# Altium project Industrial_IOT_Dev_Brd-v1.0.PrjPcb (part 5 of 7)

## Sheet Digital-Input-Sheet.SchDoc
size 420 x 297 mm; SheetNumber: 6; SheetTotal: 9
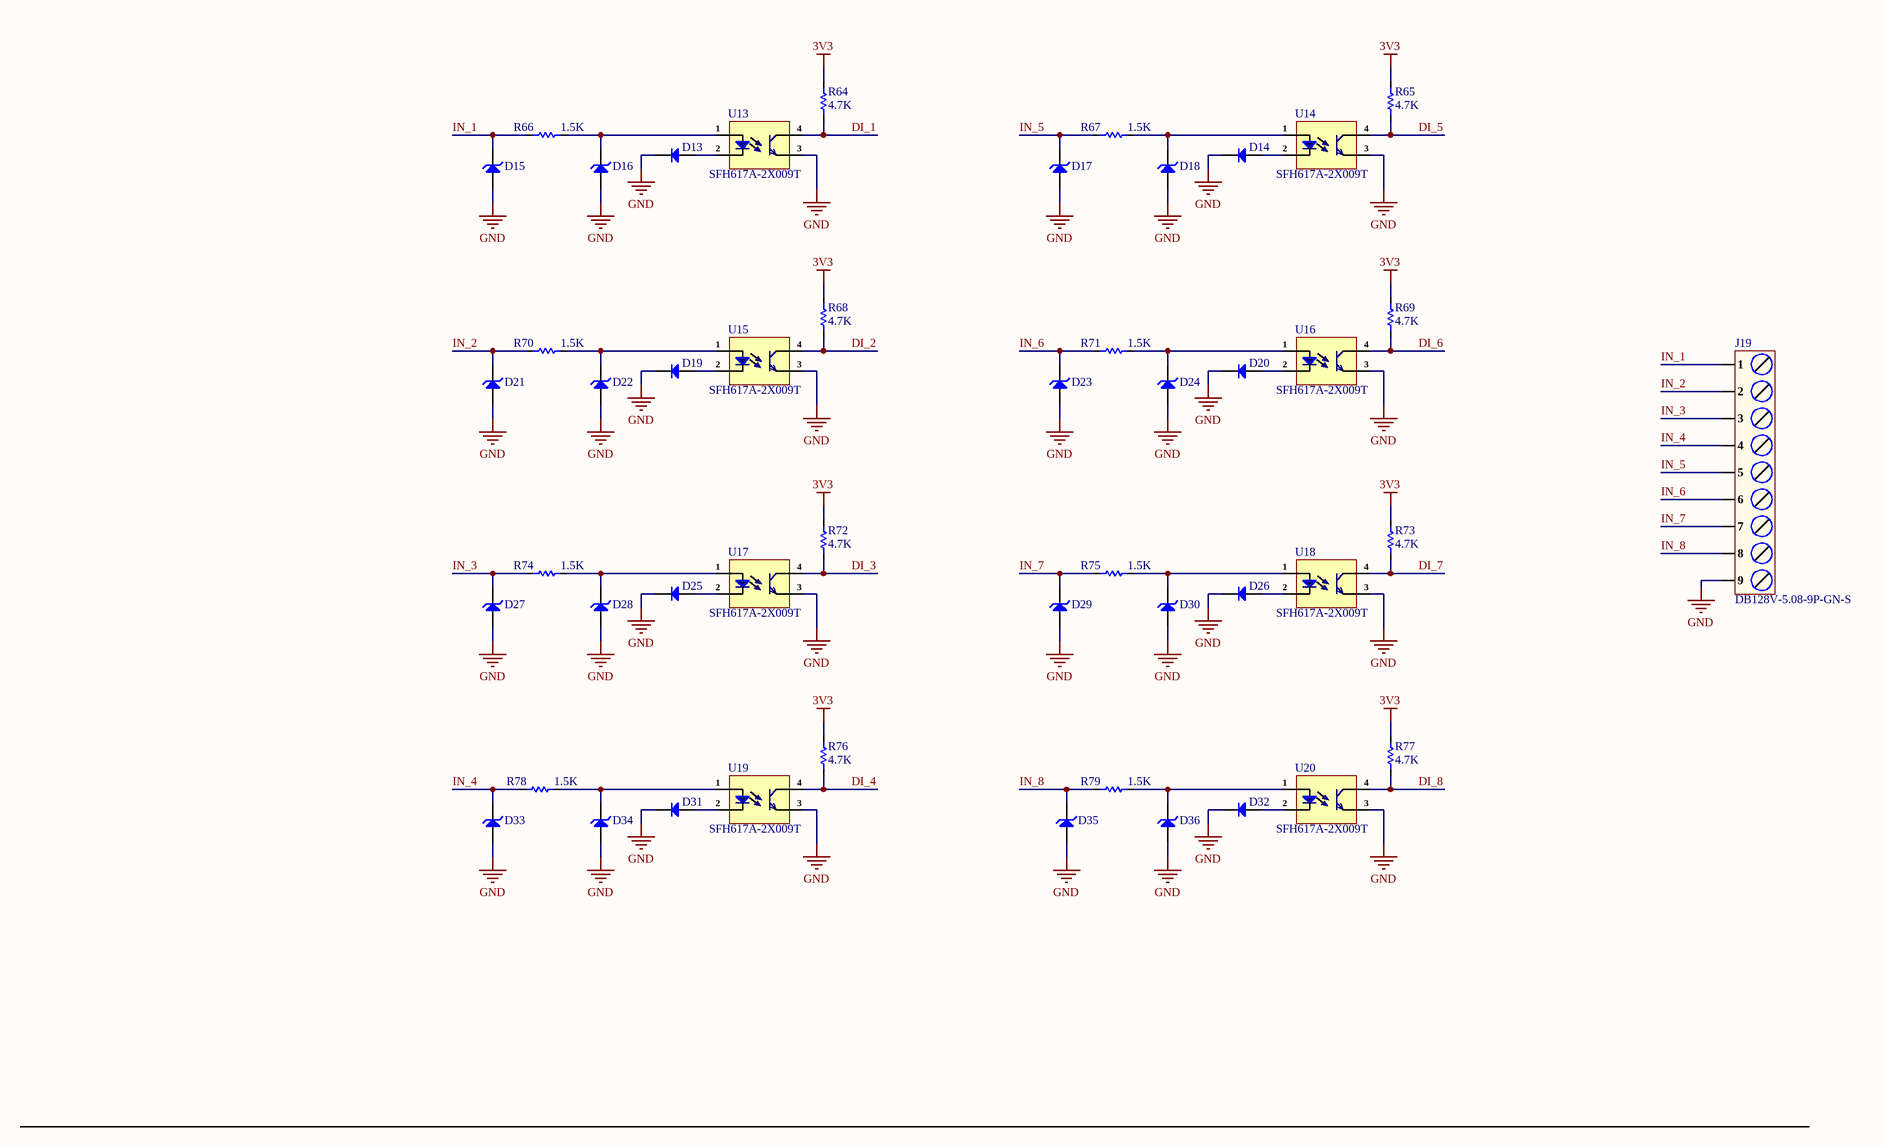
[diagram p5: Digital-Input-Sheet.SchDoc]

### Parts
D13  1N4148W-7-F  [SOD-123]  (value not drawn)
D14  1N4148W-7-F  [SOD-123]  (value not drawn)
D15  AZ4024-01G  [SOD-123]  (value not drawn)
D16  BZT52C24  [SOD-123]  (value not drawn)
D17  AZ4024-01G  [SOD-123]  (value not drawn)
D18  BZT52C24  [SOD-123]  (value not drawn)
D19  1N4148W-7-F  [SOD-123]  (value not drawn)
D20  1N4148W-7-F  [SOD-123]  (value not drawn)
D21  AZ4024-01G  [SOD-123]  (value not drawn)
D22  BZT52C24  [SOD-123]  (value not drawn)
D23  AZ4024-01G  [SOD-123]  (value not drawn)
D24  BZT52C24  [SOD-123]  (value not drawn)
D25  1N4148W-7-F  [SOD-123]  (value not drawn)
D26  1N4148W-7-F  [SOD-123]  (value not drawn)
D27  AZ4024-01G  [SOD-123]  (value not drawn)
D28  BZT52C24  [SOD-123]  (value not drawn)
D29  AZ4024-01G  [SOD-123]  (value not drawn)
D30  BZT52C24  [SOD-123]  (value not drawn)
D31  1N4148W-7-F  [SOD-123]  (value not drawn)
D32  1N4148W-7-F  [SOD-123]  (value not drawn)
D33  AZ4024-01G  [SOD-123]  (value not drawn)
D34  BZT52C24  [SOD-123]  (value not drawn)
D35  AZ4024-01G  [SOD-123]  (value not drawn)
D36  BZT52C24  [SOD-123]  (value not drawn)
J19  DB128V-5.08-9P-GN-S  [DB128V-5.08-9P-GN-S]
R64  4.7K  [Res-0402]
R65  4.7K  [Res-0402]
R66  1.5K  [Res-0603]
R67  1.5K  [Res-0603]
R68  4.7K  [Res-0402]
R69  4.7K  [Res-0402]
R70  1.5K  [Res-0603]
R71  1.5K  [Res-0603]
R72  4.7K  [Res-0402]
R73  4.7K  [Res-0402]
R74  1.5K  [Res-0603]
R75  1.5K  [Res-0603]
R76  4.7K  [Res-0402]
R77  4.7K  [Res-0402]
R78  1.5K  [Res-0603]
R79  1.5K  [Res-0603]
U13  SFH617A-2X009T  [SFH617A-2X009T]
U14  SFH617A-2X009T  [SFH617A-2X009T]
U15  SFH617A-2X009T  [SFH617A-2X009T]
U16  SFH617A-2X009T  [SFH617A-2X009T]
U17  SFH617A-2X009T  [SFH617A-2X009T]
U18  SFH617A-2X009T  [SFH617A-2X009T]
U19  SFH617A-2X009T  [SFH617A-2X009T]
U20  SFH617A-2X009T  [SFH617A-2X009T]

### Nets
3V3: R64.2 R65.2 R68.2 R69.2 R72.2 R73.2 R76.2 R77.2
GND: D13.2(K) D14.2(K) D15.1(A) D16.1(A) D17.1(A) D18.1(A) D19.2(K) D20.2(K) D21.1(A) D22.1(A) D23.1(A) D24.1(A) D25.2(K) D26.2(K) D27.1(A) D28.1(A) D29.1(A) D30.1(A) D31.2(K) D32.2(K) D33.1(A) D34.1(A) D35.1(A) D36.1(A) J19.9 U13.3(E) U14.3(E) U15.3(E) U16.3(E) U17.3(E) U18.3(E) U19.3(E) U20.3(E)
DI_1: R64.1 U13.4(C)
DI_2: R68.1 U15.4(C)
DI_3: R72.1 U17.4(C)
DI_4: R76.1 U19.4(C)
DI_5: R65.1 U14.4(C)
DI_6: R69.1 U16.4(C)
DI_7: R73.1 U18.4(C)
DI_8: R77.1 U20.4(C)
IN_1: D15.2(K) J19.1 R66.1
IN_2: D21.2(K) J19.2 R70.1
IN_3: D27.2(K) J19.3 R74.1
IN_4: D33.2(K) J19.4 R78.1
IN_5: D17.2(K) J19.5 R67.1
IN_6: D23.2(K) J19.6 R71.1
IN_7: D29.2(K) J19.7 R75.1
IN_8: D35.2(K) J19.8 R79.1
NetD13_1: D13.1(A) U13.2(Ca)
NetD14_1: D14.1(A) U14.2(Ca)
NetD16_2: D16.2(K) R66.2 U13.1(An)
NetD18_2: D18.2(K) R67.2 U14.1(An)
NetD19_1: D19.1(A) U15.2(Ca)
NetD20_1: D20.1(A) U16.2(Ca)
NetD22_2: D22.2(K) R70.2 U15.1(An)
NetD24_2: D24.2(K) R71.2 U16.1(An)
NetD25_1: D25.1(A) U17.2(Ca)
NetD26_1: D26.1(A) U18.2(Ca)
NetD28_2: D28.2(K) R74.2 U17.1(An)
NetD30_2: D30.2(K) R75.2 U18.1(An)
NetD31_1: D31.1(A) U19.2(Ca)
NetD32_1: D32.1(A) U20.2(Ca)
NetD34_2: D34.2(K) R78.2 U19.1(An)
NetD36_2: D36.2(K) R79.2 U20.1(An)

### Notes on the sheet
- File:
- Title:
- Date:
- Page
- Num:
- Total:
- Drawn By: Huzaifa Ali

### Library data of the parts
D13 D14 D19 D20 D25 D26 D31 D32 = 1N4148W-7-F: DIODE GEN PURP 100V 300MA SOD123; Manufacturer: Diodes; Forward Current: 150mA; Reverse Recovery Time: 4ns; Max Forward Surge Current (Ifsm): 2A; Element Configuration: Single; Max Reverse Current: 1uA; Forward Voltage: 1.25V; Power Dissipation: 400mW; Polarity: Standard; Voltage Rating (DC): 75V; Value: 2pF; Supplier 1: Future Electronics; Manufacturer Part Number: 1N4148W-7-F; RoHS: Yes; Category: Rectifier Diodes; Stock 1: 32931000; Pricing 1: 3000=0.01840, 12000=0.01760, 45000=0.01690, 120000=0.01640, 300000=0.01560 (USD); Mounting Technology: Surface Mount; Pins: 2; Weight: 0.000353oz; Contact Plating: Tin,Matte; Min Operating Temperature: -65°C; Max Operating Temperature: 150°C; Packaging: Tape and Reel; Max Repetitive Reverse Voltage (Vrrm): 100V; Peak Non-Repetitive Surge Current: 2A; Voltage: 100V; Max Surge Current: 2A; Package Quantity: 3000; Recovery Time: 4ns; Average Rectified Current: 300mA; Power Rating: 400mW; Current Rating: 150mA; Output Current: 150mA; Max Reverse Voltage (DC): 100V; Series: -; Reverse Recovery Time-Max: 4ns; Length: 2.85mm; Width: 1.7mm; Height: 1.25mm; Radiation Hardening: No; RoHS Compliant: Yes; Reach SVHC Compliant: Yes; Lead Free: Lead Free; ComponentLink1URL: https://datasheet.ciiva.com/1179/1915529-1179304.pdf?src-supplier=Element14; ComponentLink1Description: https://datasheet.ciiva.com/1179/1915529-1179304.pdf?src-supplier=Element14; ComponentLink2URL: https://datasheet.ciiva.com/22695/1915529-22695239.pdf?src-supplier=Element14; ComponentLink2Description: https://datasheet.ciiva.com/22695/1915529-22695239.pdf?src-supplier=Element14; ComponentLink3URL: https://datasheet.ciiva.com/8300/ds30086-8300392.pdf?src-supplier=Avnet; ComponentLink3Description: https://datasheet.ciiva.com/8300/ds30086-8300392.pdf?src-supplier=Avnet; ComponentLink4URL: https://datasheet.ciiva.com/15219/getdatasheetpartid-110030-15219548.pdf?src-supplier=Verical; ComponentLink4Description: https://datasheet.ciiva.com/15219/getdatasheetpartid-110030-15219548.pdf?src-supplier=Verical; ComponentLink5URL: https://datasheet.ciiva.com/8303/ds30086-8303197.pdf?src-supplier=Avnet; ComponentLink5Description: https://datasheet.ciiva.com/8303/ds30086-8303197.pdf?src-supplier=Avnet; ComponentLink6URL: https://datasheet.ciiva.com/911/ds30086-911735.pdf?src-supplier=Digi-Key; ComponentLink6Description: https://datasheet.ciiva.com/911/ds30086-911735.pdf?src-supplier=Digi-Key; ComponentLink7URL: https://datasheet.ciiva.com/911/ds30086-911736.pdf?src-supplier=Digi-Key; ComponentLink7Description: https://datasheet.ciiva.com/911/ds30086-911736.pdf?src-supplier=Digi-Key; ComponentLink8URL: https://datasheet.ciiva.com/911/ds30086-911734.pdf?src-supplier=Digi-Key; ComponentLink8Description: https://datasheet.ciiva.com/911/ds30086-911734.pdf?src-supplier=Digi-Key; ComponentLink9URL: https://datasheet.ciiva.com/4435/ds30086-4435128.pdf?src-supplier=Mouser; ComponentLink9Description: https://datasheet.ciiva.com/4435/ds30086-4435128.pdf?src-supplier=Mouser; Supplier Part Number 1: 7634694; LCSC Part Number: C83528; Item Type: Diode
D15 D17 D21 D23 D27 D29 D33 D35 = AZ4024-01G: 26.7V 24V SOD-123 ESD and Surge Protection (TVS/ESD) ROHS; Manufacturer: AMAZING; Manufacturer Part Number: AZ4024-01G; Package: SOD-123; LCSC Part Number: C5571859; Item Type: (TVS/ESD); ComponentLink1Description: LCSC; ComponentLink1URL: https://www.lcsc.com/product-detail/ESD-and-Surge-Protection-TVS-ESD_AMAZING-AZ4024-01G_C5571859.html
D16 D18 D22 D24 D28 D30 D34 D36 = BZT52C24: Independent Type 22.8V~25.6V 500mW 24V SOD-123 Zener Diodes ROHS; Manufacturer: BORN; Manufacturer Part Number: BZT52C24; Package: SOD-123; LCSC Part Number: C266572; Item Type: Zener Diode
J19 = DB128V-5.08-9P-GN-S: 1x9P 20A -40℃~+105℃ 300V Green 12~30 Straight pin 5.08mm 2.5 1 9 Plugin,P=5.08mm Screw terminal ROHS; Manufacturer: DIBO; Item Type: Terminal Block; Manufacturer Part Number: DB128V-5.08-9P-GN-S; Package: Plugin,P=5.08mm; LCSC Part Number: C2938972; ComponentLink1Description: LCSC; ComponentLink1URL: https://www.lcsc.com/product-detail/Screw-terminal_DIBO-DB128V-5-08-9P-GN-S_C2938972.html
R64 R65 R68 R69 R72 R73 R76 R77 = RC0402FR-074K7L: RES 4.7K OHM 1% 1/16W 0402; Manufacturer: Yageo; Voltage Rating (DC): 50V; Power Rating: 62.5mW; Resistance: 4.7kR; Temperature Coefficient: 100ppm/°C; Max Power Dissipation: 63mW; Item Type: Resistor; Supplier 1: Avnet; Manufacturer Part Number: RC0402FR-074K7L; RoHS: Yes; Category: Chip SMD Resistors; Stock 1: 2420000; Pricing 1: 10000=0.00085 (USD); Case/Package: 0402; Number of Pins: 2; Case Code (Imperial): 0402; Case Code (Metric): 1005; Size Code: 0402; Min Operating Temperature: -55°C; Max Operating Temperature: 155°C; Tolerance: 1%; Voltage Rating: 50V; Packaging: Tape and Reel; Resistor Type: Thick Film; Termination: SMD/SMT; Features: Moisture Resistant; Series: RC; Number of Terminations: 2; Resistance Tolerance: 1%; Construction: Rectangular; Length: 1mm; Width: 0.5mm; Height: 0.32mm; Depth: 0.5mm; Height - Seated (Max): 0.016inch; RoHS Compliant: Yes; Reach SVHC Compliant: Yes; Military Standard: Not; Lead Free: Lead Free; ComponentLink1URL: https://datasheet.ciiva.com/22661/1686128-22661342.pdf?src-supplier=Element14; ComponentLink1Description: https://datasheet.ciiva.com/22661/1686128-22661342.pdf?src-supplier=Element14; ComponentLink2URL: https://datasheet.ciiva.com/7850/1018594-7850022.pdf?src-supplier=Element14; ComponentLink2Description: https://datasheet.ciiva.com/7850/1018594-7850022.pdf?src-supplier=Element14; ComponentLink3URL: https://datasheet.ciiva.com/7850/1018594-7850023.pdf?src-supplier=Element14; ComponentLink3Description: https://datasheet.ciiva.com/7850/1018594-7850023.pdf?src-supplier=Element14; ComponentLink4URL: https://datasheet.ciiva.com/15215/getdatasheetpartid-328119-15215035.pdf?src-supplier=Verical; ComponentLink4Description: https://datasheet.ciiva.com/15215/getdatasheetpartid-328119-15215035.pdf?src-supplier=Verical; Supplier Part Number 1: RC0402FR-074K7L; LCSC Part Number: C105871
R66 R67 R70 R71 R74 R75 R78 R79 = RC0603FR-071K5L: RES 1.5K OHM 1% 1/10W 0603; Manufacturer: Yageo; Voltage Rating (DC): 50V; Resistance: 1.5kR; Temperature Coefficient: 100ppm/°C; Power Rating: 100mW; Item Type: Resistor; Supplier 1: Arrow Electronics; Manufacturer Part Number: RC0603FR-071K5L; RoHS: Yes; Category: Chip SMD Resistors; Stock 1: 15000; Pricing 1: 1=0.00160, 5000=0.00160 (USD); Case/Package: 0603; Number of Pins: 2; Case Code (Metric): 1608; Case Code (Imperial): 0603; Size Code: 0603; Min Operating Temperature: -55°C; Max Operating Temperature: 155°C; Tolerance: 1%; Packaging: Tape and Reel; Resistor Type: Thick Film; Voltage Rating: 50V; Package Quantity: 1; Number of Terminations: 2; Termination: SMD/SMT; Max Power Dissipation: 100mW; Features: Moisture Resistant; Series: RC; Resistance Tolerance: 1%; Construction: Rectangular; Length: 0.063inch; Width: 0.031inch; Height: 0.022inch; Depth: 0.8mm; REACH SVHC: No SVHC; Lead Free: Lead Free; Military Standard: Not; RoHS Compliant: Yes; Supplier Part Number 1: RC0603FR-071K5L; LCSC Part Number: C114668
U13-U20 = SFH617A-2X009T: OPTOISOLATOR 5.3KV TRANS 4SMD; Manufacturer: Vishay; Item Type: IC; Supplier: Arrow Electronics; LCSC Part Number: C5334420; Manufacturer Part Number: SFH617A-2X009T; RoHS: Yes; Stock: 871; Pricing: 1=0.3234, 10=0.3216, 25=0.3197, 100=0.3179, 250=0.3161, 500=0.3142 (USD); ComponentLink1URL: https://datasheet.ciiva.com/18616/options-18616575.pdf?src-supplier=Digikey; ComponentLink1Description: https://datasheet.ciiva.com/18616/options-18616575.pdf?src-supplier=Digikey

## Sheet Analog-Input-Sheet.SchDoc
size 420 x 297 mm; SheetNumber: 7; SheetTotal: 9
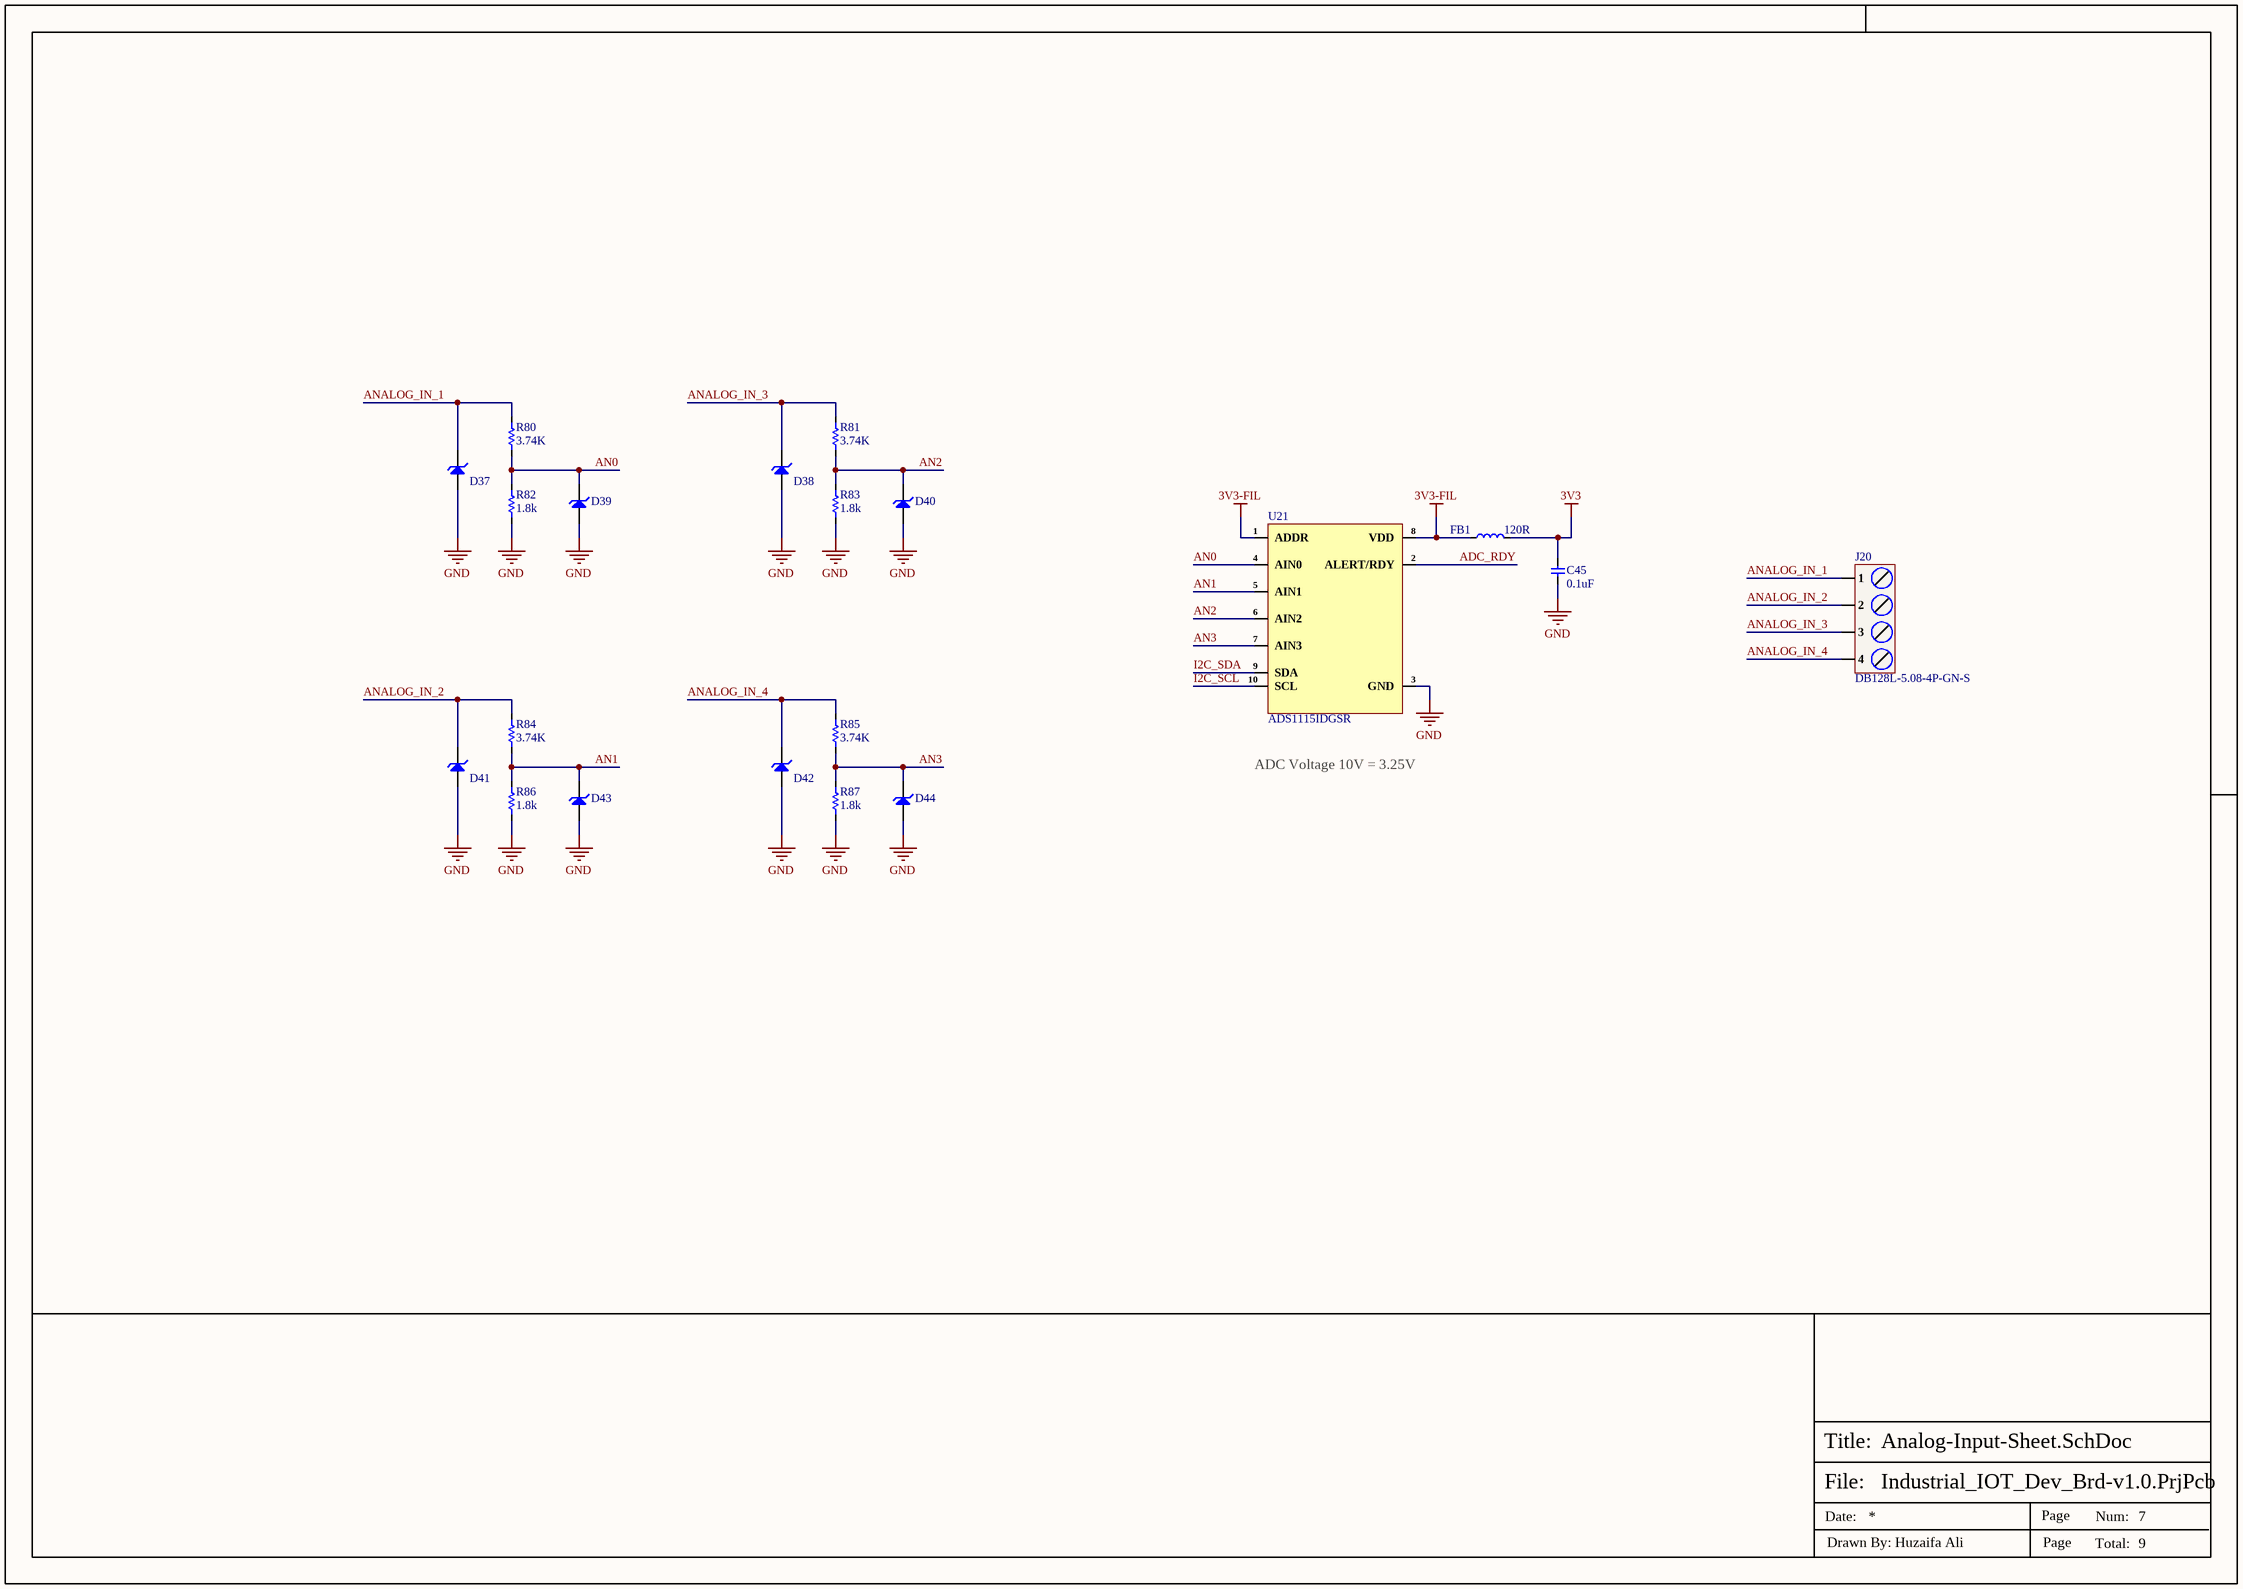
[diagram p6: Analog-Input-Sheet.SchDoc]

### Parts
C45  0.1uF  [Cap-0402]
D37  SMBJ12A  [SMB_]  (value not drawn)
D38  SMBJ12A  [SMB_]  (value not drawn)
D39  MM3Z3V3B  [SOD323F]  (value not drawn)
D40  MM3Z3V3B  [SOD323F]  (value not drawn)
D41  SMBJ12A  [SMB_]  (value not drawn)
D42  SMBJ12A  [SMB_]  (value not drawn)
D43  MM3Z3V3B  [SOD323F]  (value not drawn)
D44  MM3Z3V3B  [SOD323F]  (value not drawn)
FB1  120R  [IND-0603 (1608 Metric)]
J20  DB128L-5.08-4P-GN-S  [DB128L-5.08-4P-GN-S]
R80  3.74K  [Res-0603]
R81  3.74K  [Res-0603]
R82  1.8k  [Res-0603]
R83  1.8k  [Res-0603]
R84  3.74K  [Res-0603]
R85  3.74K  [Res-0603]
R86  1.8k  [Res-0603]
R87  1.8k  [Res-0603]
U21  ADS1115IDGSR  [VSSOP-10]

### Nets
3V3: C45.1 FB1.2
3V3-FIL: FB1.1 U21.1(ADDR) U21.8(VDD)
GND: C45.2 D37.1(A) D38.1(A) D39.1(A) D40.1(A) D41.1(A) D42.1(A) D43.1(A) D44.1(A) R82.1 R83.1 R86.1 R87.1 U21.3(GND)
ADC_RDY: U21.2(ALERT/RDY)
AN0: D39.2(K) R80.1 R82.2 U21.4(AIN0)
AN1: D43.2(K) R84.1 R86.2 U21.5(AIN1)
AN2: D40.2(K) R81.1 R83.2 U21.6(AIN2)
AN3: D44.2(K) R85.1 R87.2 U21.7(AIN3)
ANALOG_IN_1: D37.2(K) J20.1 R80.2
ANALOG_IN_2: D41.2(K) J20.2 R84.2
ANALOG_IN_3: D38.2(K) J20.3 R81.2
ANALOG_IN_4: D42.2(K) J20.4 R85.2
I2C_SCL: U21.10(SCL)
I2C_SDA: U21.9(SDA)

### Notes on the sheet
- ADC Voltage 10V = 3.25V
- File:
- Title:
- Date:
- Page
- Num:
- Total:
- Drawn By: Huzaifa Ali

### Library data of the parts
C45 = CC0402JRX7R7BB104: CAP CER 0.1UF 16V X7R 0402; Manufacturer: Yageo; Material: 4241ConductorMaterial; Value: 100nF; Tolerance: 5%; Item Type: Capacitor; Supplier: Digikey; Supplier Part Number: 311-1676-1-ND; Manufacturer Part Number: CC0402JRX7R7BB104; RoHS: Yes; Category: Ceramic Capacitors; Stock: 1659111; Pricing: 1=0.1, 10=0.046, 50=0.0262, 100=0.0203, 500=0.01528, 1000=0.012, 2500=0.01091, 5000=0.01004 (USD); Mounting Technology: Surface Mount; Case/Package: 0402; Case Code (Metric): 1005; Case Code (Imperial): 0402; Min Operating Temperature: -55°C; Max Operating Temperature: 125°C; Dielectric: X7R; Packaging: Tape and Reel; Package Quantity: 10000; Voltage Rating (DC): 16V; Voltage Rating: 16V; Series: CC; Construction: Flat; Length: 0.039inch; Width: 0.02inch; Height: 0.5mm; Thickness: 0.022inch; Lead Free: Lead Free; Halogen Free: Halogen Free; RoHS Compliant: Yes; ComponentLink1URL: https://datasheet.ciiva.com/13210/upy-gphc-x7r-6-3v-to-50v-8-12304-13210152.pdf?src-supplier=Mouser; ComponentLink1Description: https://datasheet.ciiva.com/13210/upy-gphc-x7r-6-3v-to-50v-8-12304-13210152.pdf?src-supplier=Mouser; LCSC Part Number: C541464
D37 D38 D41 D42 = SMBJ12A: TVS DIODE 12VWM 19.9VC DO214AA; Manufacturer: Littelfuse; Item Type: TVS Diodes; Supplier: Digikey; LCSC Part Number: C151251; Manufacturer Part Number: SMBJ12A; RoHS: Yes; Stock: 39718; Pricing: 1=0.32, 10=0.215, 100=0.104 (USD); ComponentLink1URL: https://datasheet.ciiva.com/15143/getdatasheetpartid-185160-15143884.pdf?src-supplier=Verical; ComponentLink1Description: https://datasheet.ciiva.com/15143/getdatasheetpartid-185160-15143884.pdf?src-supplier=Verical; ComponentLink2URL: https://datasheet.ciiva.com/34302/1546611-34302457.pdf?src-supplier=Jameco; ComponentLink2Description: https://datasheet.ciiva.com/34302/1546611-34302457.pdf?src-supplier=Jameco; ComponentLink3URL: https://datasheet.ciiva.com/25624/0900766b810f4eeb-25624681.pdf?src-supplier=Rs; ComponentLink3Description: https://datasheet.ciiva.com/25624/0900766b810f4eeb-25624681.pdf?src-supplier=Rs; ComponentLink4URL: https://datasheet.ciiva.com/16287/littelfuse-tvs-diode-smbj-16287565.pdf?src-supplier=Future+Electronics; ComponentLink4Description: https://datasheet.ciiva.com/16287/littelfuse-tvs-diode-smbj-16287565.pdf?src-supplier=Future+Electronics; ComponentLink5URL: https://datasheet.ciiva.com/331/littelfuse-tvs-diode-smbj-datasheet-pdf-331137.pdf?src-supplier=Digikey; ComponentLink5Description: https://datasheet.ciiva.com/331/littelfuse-tvs-diode-smbj-datasheet-pdf-331137.pdf?src-supplier=Digikey; ComponentLink6URL: https://datasheet.ciiva.com/331/littelfuse-tvs-diode-smbj-datasheet-pdf-331138.pdf?src-supplier=Digikey; ComponentLink6Description: https://datasheet.ciiva.com/331/littelfuse-tvs-diode-smbj-datasheet-pdf-331138.pdf?src-supplier=Digikey; ComponentLink7URL: https://datasheet.ciiva.com/331/littelfuse-tvs-diode-smbj-datasheet-pdf-331139.pdf?src-supplier=Digikey; ComponentLink7Description: https://datasheet.ciiva.com/331/littelfuse-tvs-diode-smbj-datasheet-pdf-331139.pdf?src-supplier=Digikey; ComponentLink8URL: https://datasheet.ciiva.com/8062/littelfuse-tvs-diode-smbj-8062301.pdf?src-supplier=Element14; ComponentLink8Description: https://datasheet.ciiva.com/8062/littelfuse-tvs-diode-smbj-8062301.pdf?src-supplier=Element14
D39 D40 D43 D44 = MM3Z3V3B: DIODE ZENER 3.3V 200MW SOD323F; Manufacturer: ON Semiconductor / Fairchild; Forward Voltage: 1V; Tolerance: 2%; Impedance: 89R; Max Reverse Leakage Current: 4.5uA; Test Current: 5mA; Element Configuration: Single; Supplier 1: Digi-Key; Manufacturer Part Number: MM3Z3V3B; Stock 1: 473644; Pricing 1: 1=0.22, 10=0.18, 100=0.0956, 500=0.06288, 1000=0.04276 (USD); Mount: Surface Mount; Number of Pins: 2; Weight: 0.0276g; Min Operating Temperature: -65°C; Max Operating Temperature: 150°C; Packaging: Tape and Reel; Package Quantity: 1; Max Power Dissipation: 200mW; Zener Voltage: 3.3V; Voltage Tolerance: 2%; Power Dissipation: 200mW; Working Voltage: 3.3V; Peak Reverse Current: 4.5uA; Length: 1.3mm; Height: 1mm; Width: 1.7mm; Radiation Hardening: No; REACH SVHC: No SVHC; Lead Free: Lead Free; ComponentLink1URL: http://www.onsemi.com/pub/Collateral/MM3Z9V1B-D.pdf?src-supplier=Digi-Key; ComponentLink1Description: http://www.onsemi.com/pub/Collateral/MM3Z9V1B-D.pdf?src-supplier=Digi-Key; ComponentLink2URL: http://www.mouser.com/ds/2/149/MM3Z3V3B-187166.pdf?src-supplier=Mouser; ComponentLink2Description: http://www.mouser.com/ds/2/149/MM3Z3V3B-187166.pdf?src-supplier=Mouser; ComponentLink3URL: https://www.fairchildsemi.com/datasheets/MM/MM3Z9V1B.pdf?src-supplier=Avnet; ComponentLink3Description: https://www.fairchildsemi.com/datasheets/MM/MM3Z9V1B.pdf?src-supplier=Avnet; ComponentLink4URL: http://www.farnell.com/datasheets/1706525.pdf?src-supplier=Element14; ComponentLink4Description: http://www.farnell.com/datasheets/1706525.pdf?src-supplier=Element14; Supplier Part Number 1: MM3Z3V3BCT-ND; LCSC Part Number: C2978865; Item Type: Diode
FB1 = BLM18PG121SN1D: Ferrite Beads Multi-Layer 120Ohm 25% 100MHz 2A 50mOhm DCR 0603 Paper T/R; Manufacturer: Murata Electronics; Material: Steel,Ferrite; Number of Lines: 1; DC Resistance (DCR): 50mR; Shielding: Unshielded; Manufacturer Part Number: BLM18PG121SN1D; Package: 0603; LCSC Part Number: C14709; Item Type: Ferrite Bead; ComponentLink1Description: LCSC; ComponentLink1URL: https://www.lcsc.com/product-detail/Ferrite-Beads_Murata-Electronics-BLM18PG121SN1D_C14709.html; Supplier: Digikey; Supplier Part Number: 490-1037-1-ND; RoHS: Yes; Category: Ferrite Beads and Chips; Stock: 1240; Pricing: 1=0.1, 10=0.078, 25=0.0712, 50=0.064, 100=0.0469, 250=0.03412, 500=0.03128, 1000=0.02701 (USD); Case/Package: 0603; Pins: 2; Core Material: Ferrite; Case Code (Metric): 1608; Case Code (Imperial): 0603; Min Operating Temperature: -55°C; Max Operating Temperature: 125°C; Tolerance: 25%; Impedance: 120R; Package Quantity: 1; Max Current Rating: 2A; Packaging: Tape and Reel; Current Rating: 2A; Max DC Current: 2A; Termination: SMD/SMT; Test Frequency: 100MHz; DC Current: 2A; Frequency: 100MHz; Number of Circuits: 1; Series: BLM18P; DC Resistance-Max: 50mR; RMS Current (Irms): 2A; ESR: 50mR; Length: 1.6mm; Width: 0.8mm; Height: 0.8mm; Depth: 0.8mm; Radiation Hardening: No; Reach SVHC Compliant: No; Lead Free: Lead Free; RoHS Compliant: Yes; ComponentLink2URL: https://datasheet.ciiva.com/5709/1740433-5709171.pdf?src-supplier=Farnell; ComponentLink2Description: https://datasheet.ciiva.com/5709/1740433-5709171.pdf?src-supplier=Farnell; ComponentLink3URL: https://datasheet.ciiva.com/19454/1845013-19454715.pdf?src-supplier=Jameco; ComponentLink3Description: https://datasheet.ciiva.com/19454/1845013-19454715.pdf?src-supplier=Jameco; ComponentLink4URL: https://datasheet.ciiva.com/11799/0900766b81275ca5-11799546.pdf?src-supplier=Rs; ComponentLink4Description: https://datasheet.ciiva.com/11799/0900766b81275ca5-11799546.pdf?src-supplier=Rs; ComponentLink5URL: https://datasheet.ciiva.com/3854/5emiapbde-1-3854039.pdf?src-supplier=Arrow+Electronics; ComponentLink5Description: https://datasheet.ciiva.com/3854/5emiapbde-1-3854039.pdf?src-supplier=Arrow+Electronics; ComponentLink6URL: https://datasheet.ciiva.com/29347/442365-da-01-en-chip-drossel-0603-120r-2000ma-1-6x0-8mm-29347911.pdf?src-supplier=Conrad; ComponentLink6Description: https://datasheet.ciiva.com/29347/442365-da-01-en-chip-drossel-0603-120r-2000ma-1-6x0-8mm-29347911.pdf?src-supplier=Conrad; ComponentLink7URL: https://datasheet.ciiva.com/8021/1740433-8021493.pdf?src-supplier=Element14; ComponentLink7Description: https://datasheet.ciiva.com/8021/1740433-8021493.pdf?src-supplier=Element14; ComponentLink8URL: https://datasheet.ciiva.com/8021/1740433-8021494.pdf?src-supplier=Element14; ComponentLink8Description: https://datasheet.ciiva.com/8021/1740433-8021494.pdf?src-supplier=Element14; ComponentLink9URL: https://datasheet.ciiva.com/14122/blm-series-eng-tds-14122905.pdf?src-supplier=Distrelec; ComponentLink9Description: https://datasheet.ciiva.com/14122/blm-series-eng-tds-14122905.pdf?src-supplier=Distrelec; ComponentLink10URL: https://datasheet.ciiva.com/6212/l0110s0100blm18p-6212502.pdf?src-supplier=Digikey; ComponentLink10Description: https://datasheet.ciiva.com/6212/l0110s0100blm18p-6212502.pdf?src-supplier=Digikey; ComponentLink11URL: https://datasheet.ciiva.com/6212/l0110s0100blm18p-6212504.pdf?src-supplier=Digikey; ComponentLink11Description: https://datasheet.ciiva.com/6212/l0110s0100blm18p-6212504.pdf?src-supplier=Digikey; ComponentLink12URL: https://datasheet.ciiva.com/3081/l0110s0100blm18p-3081632.pdf?src-supplier=Avnet; ComponentLink12Description: https://datasheet.ciiva.com/3081/l0110s0100blm18p-3081632.pdf?src-supplier=Avnet; ComponentLink13URL: https://datasheet.ciiva.com/41449/001172297-da-01-en-drossel-0603-120r-1-6x0-8mm-4000st-41449659.pdf?src-supplier=Conrad; ComponentLink13Description: https://datasheet.ciiva.com/41449/001172297-da-01-en-drossel-0603-120r-1-6x0-8mm-4000st-41449659.pdf?src-supplier=Conrad
J20 = DB128L-5.08-4P-GN-S: 1x4P 18A -40℃~+105℃ 250V Green 12~30 Direct Insert 5.08mm 2.5 1 4 Plugin,P=5.08mm Screw Terminal Blocks ROHS; Manufacturer: DORABO; Manufacturer Part Number: DB128L-5.08-4P-GN-S; Package: Plugin,P=5.08mm; LCSC Part Number: C2827883; Item Type: Terminal Block; ComponentLink1Description: LCSC; ComponentLink1URL: https://www.lcsc.com/product-detail/Screw-Terminal-Blocks_DORABO-DB128L-5-08-4P-GN-S_C2827883.html
R80 R81 R84 R85 = RT0603BRD073K74L: RES SMD 3.74KOHM 0.1% 1/10W 0603; Manufacturer: Yageo; Item Type: Resistors; Supplier: Digikey; LCSC Part Number: C861382; Manufacturer Part Number: RT0603BRD073K74L; RoHS: Yes; Stock: 18903; Pricing: 1=0.14, 10=0.104, 50=0.0822, 100=0.0737, 500=0.05612, 1000=0.04959 (USD); ComponentLink1URL: https://datasheet.ciiva.com/2585/pyu-rt-1-to-0-05-rohs-l-5-2585932.pdf?src-supplier=Digikey; ComponentLink1Description: https://datasheet.ciiva.com/2585/pyu-rt-1-to-0-05-rohs-l-5-2585932.pdf?src-supplier=Digikey; ComponentLink2URL: https://datasheet.ciiva.com/12704/pyu-rt-1-to-0-05-rohs-l-4-12704766.pdf?src-supplier=Mouser; ComponentLink2Description: https://datasheet.ciiva.com/12704/pyu-rt-1-to-0-05-rohs-l-4-12704766.pdf?src-supplier=Mouser
R82 R83 R86 R87 = RT0603BRD071K8L: RES SMD 1.8K OHM 0.1% 1/10W 0603; Manufacturer: Yageo; Resistance: 1.8kR; Temperature Coefficient: 25ppm/°C; Power Rating: 100mW; Voltage Rating: 75V; Voltage Rating (DC): 50V; Item Type: Resistor; Supplier 1: Rs; Manufacturer Part Number: RT0603BRD071K8L; RoHS: Yes; Category: Chip SMD Resistors; Stock 1: 3210; Pricing 1: 100=0.21900, 250=0.20400, 500=0.19000, 1000=0.17400 (GBP); Case/Package: 0603; Contact Plating: Tin,Matte; Case Code (Metric): 1608; Case Code (Imperial): 0603; Min Operating Temperature: -55°C; Max Operating Temperature: 125°C; Tolerance: 0.1%; Resistor Type: Thin Film; Package Quantity: 5000; Packaging: Tape and Reel; Number of Terminations: 2; Termination: SMD/SMT; Max Power Dissipation: 100mW; Features: Moisture Resistant; Series: RT; Construction: Rectangular; Length: 0.063inch; Width: 0.031inch; Height: 0.022inch; Depth: 0.8mm; Radiation Hardening: No; Military Standard: Not; Lead Free: Lead Free; RoHS Compliant: Yes; ComponentLink1URL: https://datasheet.ciiva.com/12694/pyu-rt-1-to-0-05-rohs-l-4-12694842.pdf?src-supplier=Mouser; ComponentLink1Description: https://datasheet.ciiva.com/12694/pyu-rt-1-to-0-05-rohs-l-4-12694842.pdf?src-supplier=Mouser; ComponentLink2URL: https://datasheet.ciiva.com/2585/pyu-rt-1-to-0-05-rohs-l-4-2585762.pdf?src-supplier=Digi-Key; ComponentLink2Description: https://datasheet.ciiva.com/2585/pyu-rt-1-to-0-05-rohs-l-4-2585762.pdf?src-supplier=Digi-Key; Supplier Part Number 1: 1991446P; LCSC Part Number: C705745
U21 = ADS1115IDGSR: IC ADC 16BIT SIGMA-DELTA 10VSSOP; Manufacturer: Texas Instruments; Interface: I2C; Number of Bits: 16; Sampling Rate: 860S/s; Number of A/D Converters: 1; Resolution: 16b; Polarity: Bipolar; Min Supply Voltage: 2V; Max Supply Voltage: 5.5V; Supply Type: Single; Conversion Rate: 0.86KS/s; Number of Inputs: 4; Integral Nonlinearity (INL): 1LSB; Power Dissipation: 900uW; Nominal Supply Current: 150uA; Number of Channels: 2; Supplier: Mouser; Supplier Part Number: 595-ADS1115IDGSR; Manufacturer Part Number: ADS1115IDGSR; RoHS: Yes; Category: Analog to Digital Converters (ADCs); Stock: 5925; Pricing: 1=5.44, 10=4.76, 50=4.76, 100=4.01, 1000=2.88, 10000=2.78 (USD); Case/Package: VSSOP; Pins: 10; Contact Plating: Gold; Min Operating Temperature: -40°C; Max Operating Temperature: 125°C; Package Quantity: 2500; Packaging: Tape and Reel; Number of Converters: 1; Max Supply Voltage (DC): 5.5V; Min Supply Voltage (DC): 2V; Series: -; Length: 3mm; Width: 3mm; Height: 1.07mm; Thickness: 1.02mm; Reach SVHC Compliant: No; Lead Free: Lead Free; RoHS Compliant: Yes; ComponentLink1URL: https://datasheet.ciiva.com/4031/47725463s8438921n7713-4031028.pdf?src-supplier=Arrow+Electronics; ComponentLink1Description: https://datasheet.ciiva.com/4031/47725463s8438921n7713-4031028.pdf?src-supplier=Arrow+Electronics; LCSC Part Number: C37593; Item Type: IC

## Sheet Ethernet-PoE-Sheet.SchDoc
size 420 x 297 mm; SheetNumber: 8; SheetTotal: 9
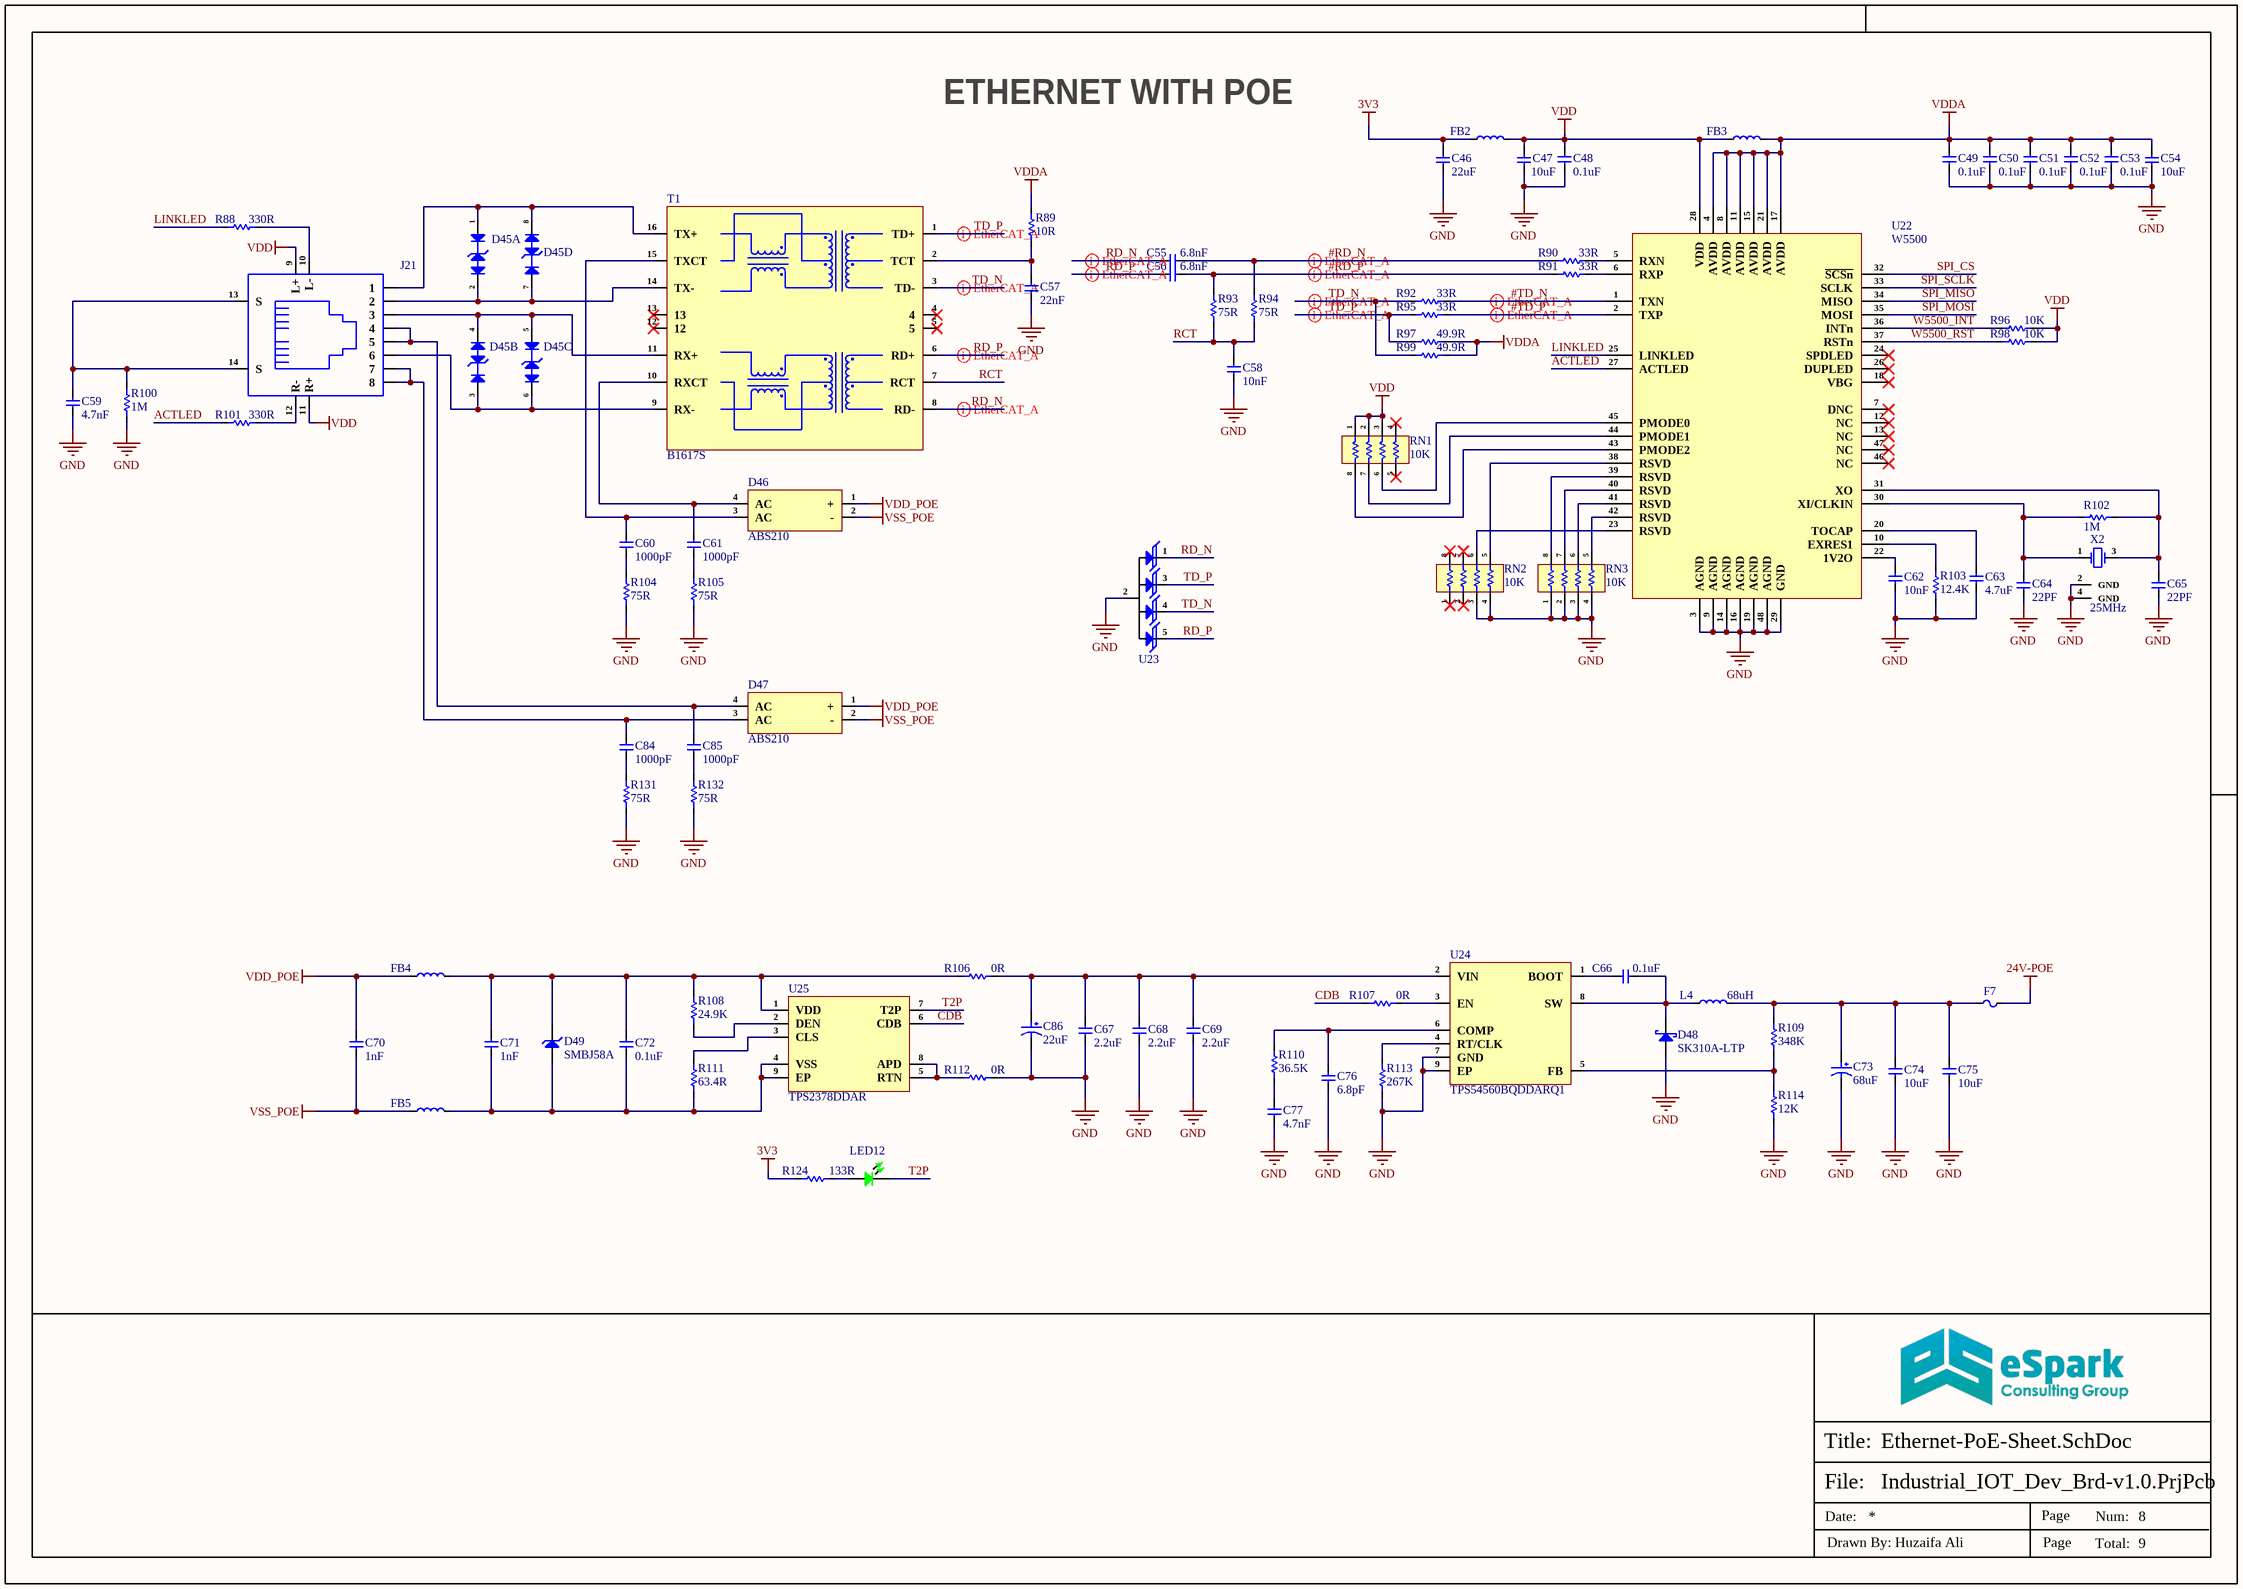
[diagram p7: Ethernet-PoE-Sheet.SchDoc]

### Parts
C46  22uF  [Cap-0805]
C47  10uF  [Cap-0603]
C48  0.1uF  [Cap-0402]
C49  0.1uF  [Cap-0402]
C50  0.1uF  [Cap-0402]
C51  0.1uF  [Cap-0402]
C52  0.1uF  [Cap-0402]
C53  0.1uF  [Cap-0402]
C54  10uF  [Cap-0603]
C55  6.8nF  [Cap-0603]
C56  6.8nF  [Cap-0603]
C57  22nF  [Cap-0603]
C58  10nF  [Cap-0603]
C59  4.7nF  [Cap-1206]
C60  1000pF  [Cap-1206]
C61  1000pF  [Cap-1206]
C62  10nF  [Cap-0603]
C63  4.7uF  [Cap-0603]
C64  22PF  [Cap-0402]
C65  22PF  [Cap-0402]
C66  0.1uF  [Cap-0603]
C67  2.2uF  [Cap-0805]
C68  2.2uF  [Cap-0805]
C69  2.2uF  [Cap-0805]
C70  1nF  [Cap-0603]
C71  1nF  [Cap-0603]
C72  0.1uF  [Cap-0603]
C73  68uF  [RVT1H680M0607]
C74  10uF  [Cap-1210]
C75  10uF  [Cap-1210]
C76  6.8pF  [Cap-0402]
C77  4.7nF  [Cap-0402]
C84  1000pF  [Cap-1206]
C85  1000pF  [Cap-1206]
C86  22uF  [EEEFK1J220P]
D45  SLVU2.8-4BTG  [SOIC-8(0.154", 3.90mm Width)]  (value not drawn)  (parts A,B,C,D of 4)
D46  ABS210  [ABS]
D47  ABS210  [ABS]
D48  SK310A-LTP  [SMA(DO-214AC)]
D49  SMBJ58A  [SMB_]
F7  1210L075/24PR  [FUSE-1210]  (value not drawn)
FB2  CBM201209U601T  [Ind-0805]  (value not drawn)
FB3  CBM201209U601T  [Ind-0805]  (value not drawn)
FB4  MPZ1608S221ATD25  [IND-0603 (1608 Metric)]  (value not drawn)
FB5  MPZ1608S221ATD25  [IND-0603 (1608 Metric)]  (value not drawn)
J21  R-RJ45R08P-C000  [R-RJ45R08P-C000]  (value not drawn)
L4  68uH  [FCH1365-680M]
LED12  Emerald  [LED-0603]  (value not drawn)
R88  330R  [Res-0603]
R89  10R  [Res-0603]
R90  33R  [Res-0603]
R91  33R  [Res-0603]
R92  33R  [Res-0603]
R93  75R  [Res-0603]
R94  75R  [Res-0603]
R95  33R  [Res-0603]
R96  10K  [Res-0402]
R97  49.9R  [Res-0603]
R98  10K  [Res-0402]
R99  49.9R  [Res-0603]
R100  1M  [Res-0603]
R101  330R  [Res-0603]
R102  1M  [Res-0402]
R103  12.4K  [Res-0603]
R104  75R  [Res-0603]
R105  75R  [Res-0603]
R106  0R  [Res-0805]
R107  0R  [Res-0402]
R108  24.9K  [Res-0603]
R109  348K  [RES-0805]
R110  36.5K  [Res-0603]
R111  63.4R  [Res-0603]
R112  0R  [Res-0805]
R113  267K  [Res-0603]
R114  12K  [Res-0603]
R124  133R  [Res-0402]
R131  75R  [Res-0603]
R132  75R  [Res-0603]
RN1  10K  [YC164-FR-0710KL]
RN2  10K  [YC164-FR-0710KL]
RN3  10K  [YC164-FR-0710KL]
T1  B1617S  [B1617S]
U22  W5500  [48-LQFP (7x7)_]
U23  SP0504BAHTG  [SOT-23-5]  (value not drawn)
U24  TPS54560BQDDARQ1  [8-SO PowerPad]
U25  TPS2378DDAR  [8-SO PowerPad]
X2  25MHz  [SMD3225-4P]

### Nets
3V3: C46.2 FB2.1 R124.1
24V-POE: F7.2
GND: C46.1 C47.1 C48.2 C49.2 C50.2 C51.2 C52.2 C53.2 C54.1 C57.1 C58.1 C59.1 C62.1 C63.1 C64.1 C65.1 C67.1 C68.1 C69.1 C73.2 C74.1 C75.1 C76.1 C77.1 C86.2 D48.2(A) R100.1 R103.1 R104.1 R105.1 R112.2 R113.1 R114.1 R131.1 R132.1 RN2.3 RN2.4 RN3.1 RN3.2 RN3.3 RN3.4 U22.3(AGND) U22.9(AGND) U22.14(AGND) U22.16(AGND) U22.19(AGND) U22.29(GND) U22.48(AGND) U23.2(A) U24.7(GND) U24.9(EP) X2.2(GND) X2.4(GND)
VDD: C47.2 C48.1 FB2.2 FB3.1 J21.9(L+) J21.11(R+) R96.1 R98.1 RN1.1 RN1.2 RN1.3 U22.28(VDD)
VDD_POE: C70.2 D46.1(+) D47.1(+) FB4.1
VDDA: C49.1 C50.1 C51.1 C52.1 C53.1 C54.2 FB3.2 R89.2 R97.2 R99.2 U22.4(AVDD) U22.8(AVDD) U22.11(AVDD) U22.15(AVDD) U22.17(AVDD) U22.21(AVDD)
VSS_POE: C70.1 D46.2(-) D47.2(-) FB5.1
#RD_N: C55.2 R90.1 R94.2
#RD_P: C56.2 R91.1 R93.2
#TD_N: R92.2 U22.1(TXN)
#TD_P: R95.2 U22.2(TXP)
ACTLED: R101.1 U22.27(ACTLED)
CDB: R107.1 U25.6(CDB)
LINKLED: R88.1 U22.25(LINKLED)
RCT: C58.2 R93.1 R94.1 T1.7(RCT)
RD_N: C55.1 T1.8(RD-) U23.1(K)
RD_P: C56.1 T1.6(RD+) U23.5(K)
SPI_CS: U22.32(~{SCSn})
SPI_MISO: U22.34(MISO)
SPI_MOSI: U22.35(MOSI)
SPI_SCLK: U22.33(SCLK)
T2P: LED12.2 U25.7(T2P)
TD_N: R92.1 R99.1 T1.3(TD-) U23.4(K)
TD_P: R95.1 R97.1 T1.1(TD+) U23.3(K)
W5500_INT: R96.2 U22.36(INTn)
W5500_RST: R98.2 U22.37(RSTn)
NetC57_2: C57.2 R89.1 T1.2(TCT)
NetC59_2: C59.2 J21.13(S) J21.14(S) R100.2
NetC60_1: C60.1 R104.2
NetC60_2: C60.2 D46.3(AC) T1.15(TXCT)
NetC61_1: C61.1 R105.2
NetC61_2: C61.2 D46.4(AC) T1.10(RXCT)
NetC62_2: C62.2 U22.22(1V2O)
NetC63_2: C63.2 U22.20(TOCAP)
NetC64_2: C64.2 R102.1 U22.30(XI/CLKIN) X2.1(CRYSTAL)
NetC65_2: C65.2 R102.2 U22.31(XO) X2.3(CRYSTAL)
NetC66_1: C66.1 D48.1(K) L4.1 U24.8(SW)
NetC66_2: C66.2 U24.1(BOOT)
NetC67_2: C67.2 C68.2 C69.2 C86.1 R106.2 U24.2(VIN)
NetC71_1: C71.1 C72.1 D49.1(A) FB5.2 R111.1 U25.4(VSS) U25.9(EP)
NetC71_2: C71.2 C72.2 D49.2(K) FB4.2 R106.1 R108.2 U25.1(VDD)
NetC73_1: C73.1 C74.2 C75.2 F7.1 L4.2 R109.2
NetC76_2: C76.2 R110.2 U24.6(COMP)
NetC77_2: C77.2 R110.1
NetC84_1: C84.1 R131.2
NetC84_2: C84.2 D47.3(AC) J21.7 J21.8
NetC85_1: C85.1 R132.2
NetC85_2: C85.2 D47.4(AC) J21.4 J21.5
NetD45_1: D45.1(A) D45.8(K) J21.1 T1.16(TX+)
NetD45_2: D45.2(K) D45.7(A) J21.2 T1.14(TX-)
NetD45_3: D45.3(A) D45.6(K) J21.6 T1.9(RX-)
NetD45_4: D45.4(K) D45.5(A) J21.3 T1.11(RX+)
NetJ21_10: J21.10(L-) R88.2
NetJ21_12: J21.12(R-) R101.2
NetLED12_1: LED12.1 R124.2
NetR90_2: R90.2 U22.5(RXN)
NetR91_2: R91.2 U22.6(RXP)
NetR103_2: R103.2 U22.10(EXRES1)
NetR107_2: R107.2 U24.3(EN)
NetR108_1: R108.1 U25.2(DEN)
NetR109_1: R109.1 R114.2 U24.5(FB)
NetR111_2: R111.2 U25.3(CLS)
NetR112_1: R112.1 U25.5(RTN) U25.8(APD)
NetR113_2: R113.2 U24.4(RT/CLK)
NetRN1_6: RN1.6 U22.45(PMODE0)
NetRN1_7: RN1.7 U22.44(PMODE1)
NetRN1_8: RN1.8 U22.43(PMODE2)
NetRN2_5: RN2.5 U22.38(RSVD)
NetRN2_6: RN2.6 U22.23(RSVD)
NetRN3_5: RN3.5 U22.42(RSVD)
NetRN3_6: RN3.6 U22.41(RSVD)
NetRN3_7: RN3.7 U22.40(RSVD)
NetRN3_8: RN3.8 U22.39(RSVD)

Not connected (* = marked no-connect by the designer): RN1 4* 5*; RN2 1* 2* 7* 8*; T1 4* 5* 12* 13*; U22 7(DNC)* 12(NC)* 13(NC)* 18(VBG)* 24(SPDLED)* 26(DUPLED)* 46(NC)* 47(NC)*

### Layout directives
differential pair; differential pair class Ethernet_Lines; net class Ethernet; rule Matched Net Lengths [Tolerance = 20mil]; rule Impedance Constraint [Min = 97.00    Max = 105.0    ]: #RD_N, #RD_P, #TD_N, #TD_P, RD_N, RD_P, TD_N, TD_P

### Notes on the sheet
- ETHERNET WITH POE
- File:
- Title:
- Date:
- Page
- Num:
- Total:
- Drawn By: Huzaifa Ali